# Altium schematic sheet HDMI2.0_SHEET.SchDoc
size A4; SheetNumber: 21; SheetTotal: 23
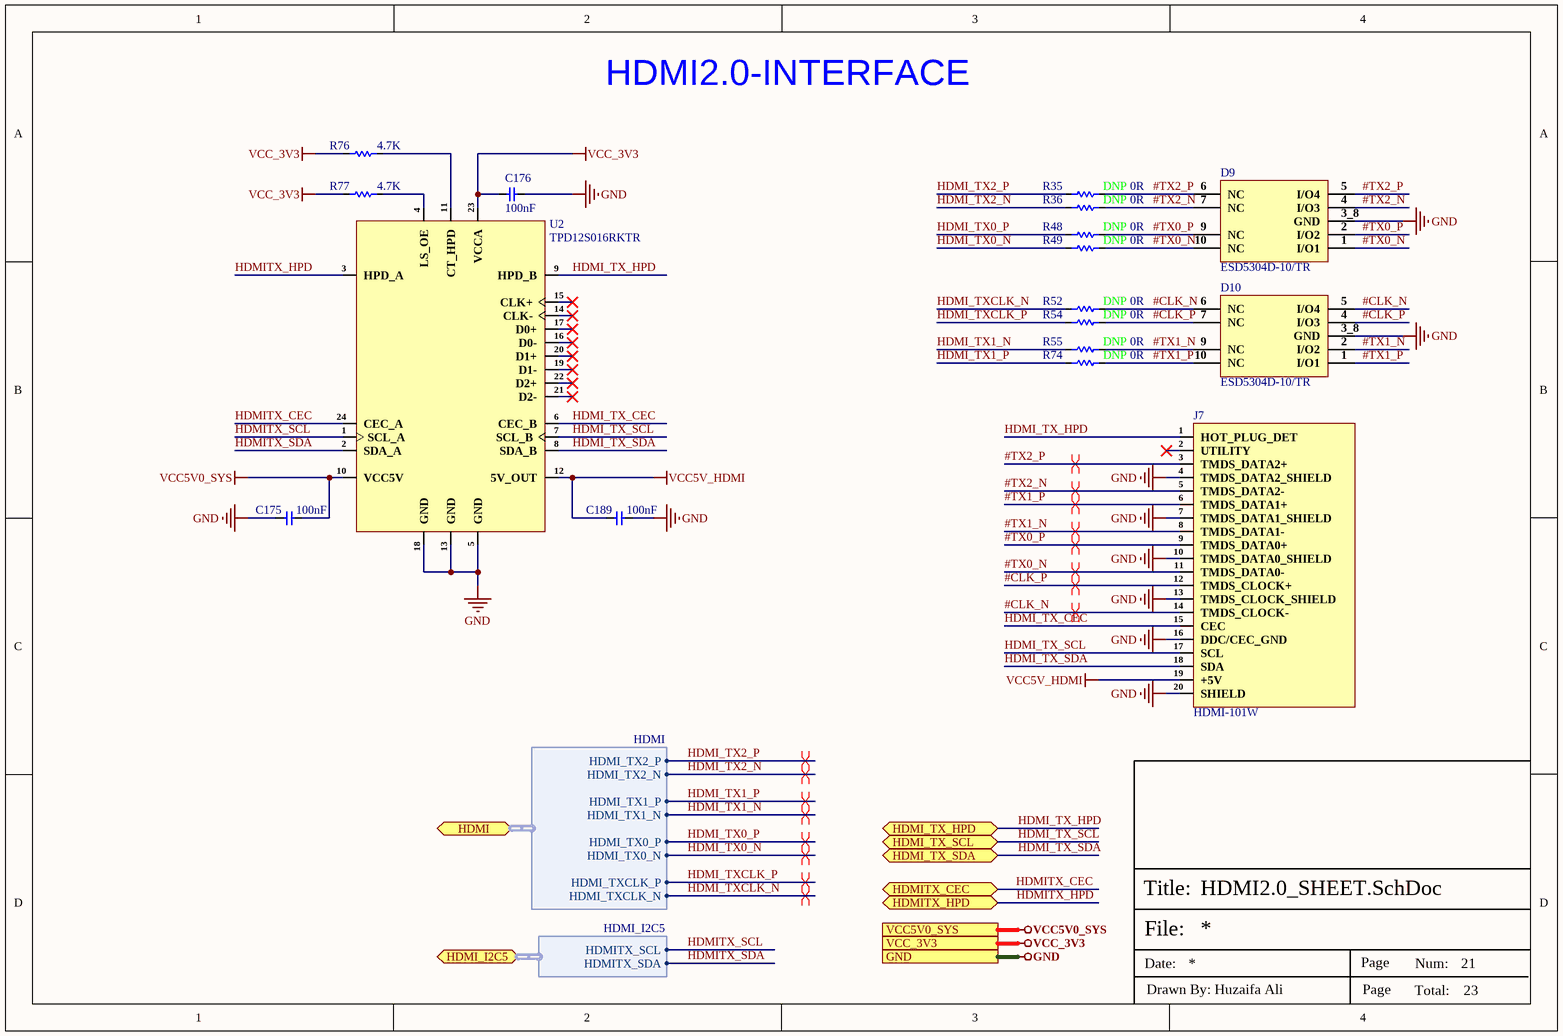
[diagram p0: HDMI2.0_SHEET.SchDoc]

## Parts
C175  100nF  [Cap-0402]
C176  100nF  [Cap-0402]
C189  100nF  [Cap-0402]
D9  ESD5304D-10/TR  [DFN2510-10L_]
D10  ESD5304D-10/TR  [DFN2510-10L_]
J7  HDMI-101W  [HDMI-101W]
R35  DNP  [Res-0201]
R36  DNP  [Res-0201]
R48  DNP  [Res-0201]
R49  DNP  [Res-0201]
R52  DNP  [Res-0201]
R54  DNP  [Res-0201]
R55  DNP  [Res-0201]
R74  DNP  [Res-0201]
R76  4.7K  [Res-0402]
R77  4.7K  [Res-0402]
U2  TPD12S016RKTR  [24-UQFN (4x2)]

## Ports
GND (see DRAM_LPDDR4_SHEET[6D], eMMC_SPI-FLASH_SHEET[1D], HDMI_TO_TYPE-C_SHEET[5D], POWER_LDO_SHEET[3D], POWER_OTHER_SHEET[3C], POWER_PMIC_RK809_CODEC[3C], POWER_PMIC_RK809_DC DC[3D], POWER_PMIC_RK809_LDO[4C], POWER_PMIC_RK809_MGM[3D], RK3566_AUDIO_SHEET[3C], RK3566_DDR-PHY_SHEET[5D], RK3566_FLASH-SD_SHEET[4C], RK3566_OSC_PMUIO_SHEET[5D], RK3566_POWER_SHEET[3D], RK3566_SARADC_GPIO[3D], RK3566_USB_PCIe_SHEET[3D], RK3566_VI_SHEET[3D], RK3566_VO_SHEET_1[3C], RK3566_VO_SHEET_2[4C], TYPE-C_INTERFACE_SHEET[3D], USB2.0_SHEET[3D], WIFI-6_SHEET[3D]), HDMI (bidir, harness HDMI, see HDMI_TO_TYPE-C_SHEET[2D], RK3566_VO_SHEET_1[2C]), HDMI_I2C5 (bidir, harness HDMI_I2C5, see RK3566_AUDIO_SHEET[3B]), HDMI_TX_HPD (bidir, see HDMI_TO_TYPE-C_SHEET[5D]), HDMI_TX_SCL (bidir, see HDMI_TO_TYPE-C_SHEET[5D]), HDMI_TX_SDA (bidir, see HDMI_TO_TYPE-C_SHEET[5D]), HDMITX_CEC (bidir, see RK3566_AUDIO_SHEET[3C]), HDMITX_HPD (bidir, see RK3566_VO_SHEET_1[3C]), VCC5V0_SYS (see HDMI_TO_TYPE-C_SHEET[5D], POWER_LDO_SHEET[3D], POWER_OTHER_SHEET[3C], POWER_PMIC_RK809_CODEC[3C], POWER_PMIC_RK809_MGM[3D], RK3566_USB_PCIe_SHEET[3C], TYPE-C_INTERFACE_SHEET[3D], USB2.0_SHEET[3D]), VCC_3V3 (see eMMC_SPI-FLASH_SHEET[1D], HDMI_TO_TYPE-C_SHEET[5D], POWER_PMIC_RK809_LDO[4C], RK3566_AUDIO_SHEET[3C], RK3566_SARADC_GPIO[3D], RK3566_USB_PCIe_SHEET[3D], RK3566_VO_SHEET_2[4C], WIFI-6_SHEET[3D])

## Harnesses
HDMI_I2C5: HDMITX_SCL, HDMITX_SDA
HDMI: HDMI_TX2_P, HDMI_TX2_N, HDMI_TX1_P, HDMI_TX1_N, HDMI_TX0_P, HDMI_TX0_N, HDMI_TXCLK_P, HDMI_TXCLK_N

## Nets
GND: C175.2 C176.1 C189.2 D9.3_8(GND) D10.3_8(GND) J7.4(TMDS_DATA2_SHIELD) J7.7(TMDS_DATA1_SHIELD) J7.10(TMDS_DATA0_SHIELD) J7.13(TMDS_CLOCK_SHIELD) J7.16(DDC/CEC_GND) J7.20(SHIELD) U2.5(GND) U2.13(GND) U2.18(GND) ; port GND
VCC5V0_SYS: C175.1 U2.10(VCC5V) ; port VCC5V0_SYS
VCC5V_HDMI: C189.1 J7.19(+5V) U2.12(5V_OUT)
VCC_3V3: C176.2 R76.2 R77.2 U2.23(VCCA) ; port VCC_3V3
#CLK_N: D10.5(I/O4) D10.6(NC) J7.14(TMDS_CLOCK-) R52.2
#CLK_P: D10.4(I/O3) D10.7(NC) J7.12(TMDS_CLOCK+) R54.2
#TX0_N: D9.1(I/O1) D9.10(NC) J7.11(TMDS_DATA0-) R49.2
#TX0_P: D9.2(I/O2) D9.9(NC) J7.9(TMDS_DATA0+) R48.2
#TX1_N: D10.2(I/O2) D10.9(NC) J7.8(TMDS_DATA1-) R55.2
#TX1_P: D10.1(I/O1) D10.10(NC) J7.6(TMDS_DATA1+) R74.2
#TX2_N: D9.4(I/O3) D9.7(NC) J7.5(TMDS_DATA2-) R36.2
#TX2_P: D9.5(I/O4) D9.6(NC) J7.3(TMDS_DATA2+) R35.2
HDMI_TX0_N: R49.1 ; port HDMI.HDMI_TX0_N
HDMI_TX0_P: R48.1 ; port HDMI.HDMI_TX0_P
HDMI_TX1_N: R55.1 ; port HDMI.HDMI_TX1_N
HDMI_TX1_P: R74.1 ; port HDMI.HDMI_TX1_P
HDMI_TX2_N: R36.1 ; port HDMI.HDMI_TX2_N
HDMI_TX2_P: R35.1 ; port HDMI.HDMI_TX2_P
HDMI_TX_CEC: J7.15(CEC) U2.6(CEC_B)
HDMI_TX_HPD: J7.1(HOT_PLUG_DET) U2.9(HPD_B) ; port HDMI_TX_HPD
HDMI_TX_SCL: J7.17(SCL) U2.7(SCL_B) ; port HDMI_TX_SCL
HDMI_TX_SDA: J7.18(SDA) U2.8(SDA_B) ; port HDMI_TX_SDA
HDMI_TXCLK_N: R52.1 ; port HDMI.HDMI_TXCLK_N
HDMI_TXCLK_P: R54.1 ; port HDMI.HDMI_TXCLK_P
HDMITX_CEC: U2.24(CEC_A) ; port HDMITX_CEC
HDMITX_HPD: U2.3(HPD_A) ; port HDMITX_HPD
HDMITX_SCL: U2.1(SCL_A) ; port HDMI_I2C5.HDMITX_SCL
HDMITX_SDA: U2.2(SDA_A) ; port HDMI_I2C5.HDMITX_SDA
NetR76_1: R76.1 U2.11(CT_HPD)
NetR77_1: R77.1 U2.4(LS_OE)

Not connected (* = marked no-connect by the designer): J7 2(UTILITY)*; U2 14(CLK-)* 15(CLK+)* 16(D0-)* 17(D0+)* 19(D1-)* 20(D1+)* 21(D2-)* 22(D2+)*

## Layout directives
differential pair; differential pair class HDMI_100R: #CLK_N, #CLK_P, #TX0_N, #TX0_P, #TX1_N, #TX1_P, #TX2_N, #TX2_P, HDMI_TX0_N, HDMI_TX0_P, HDMI_TX1_N, HDMI_TX1_P, HDMI_TX2_N, HDMI_TX2_P, HDMI_TXCLK_N, HDMI_TXCLK_P

## Notes on the sheet
- HDMI2.0-INTERFACE
- 0R
- File:
- Title:
- Date:
- Page
- Num:
- Total:
- Drawn By: Huzaifa Ali

## Library data of the parts
C175 C176 C189 = CC0402KRX5R7BB104: CAP CER 0.1UF 16V X5R 0402; Manufacturer: Yageo; Tolerance: 10%; Manufacturer Part Number: CC0402KRX5R7BB104; RoHS: Yes; Category: Ceramic Capacitors; Supplier 1: Mouser; Stock 1: 936792; Pricing 1: 1=0.10000, 10=0.02300, 50=0.02300, 100=0.01100, 1000=0.00600, 10000=0.00400 (USD); Mount: Surface Mount; Case/Package: 0402; Number of Pins: 2; Case Code (Metric): 1005; Case Code (Imperial): 0402; Min Operating Temperature: -55°C; Max Operating Temperature: 85°C; Capacitance: 100nF; Dielectric: X5R; Packaging: Tape and Reel; Voltage Rating: 16V; Package Quantity: 1; Voltage Rating (DC): 16V; Termination: SMD/SMT; Resistor Type: Ceramic; Series: CC; Construction: Flat; Length: 1mm; Width: 0.02inch; Height: 0.5mm; Thickness: 0.022inch; Depth: 0.5mm; Radiation Hardening: No; REACH SVHC: Unknown; Lead Free: Lead Free; Halogen Free: Halogen Free; RoHS Compliant: Yes; ComponentLink1URL: https://datasheet.ciiva.com/155/mlccorderingcode-155879.pdf?src-supplier=Digi-Key; ComponentLink1Description: https://datasheet.ciiva.com/155/mlccorderingcode-155879.pdf?src-supplier=Digi-Key; ComponentLink2URL: https://datasheet.ciiva.com/155/mlccorderingcode-155878.pdf?src-supplier=Digi-Key; ComponentLink2Description: https://datasheet.ciiva.com/155/mlccorderingcode-155878.pdf?src-supplier=Digi-Key; ComponentLink3URL: https://datasheet.ciiva.com/155/mlccorderingcode-155880.pdf?src-supplier=Digi-Key; ComponentLink3Description: https://datasheet.ciiva.com/155/mlccorderingcode-155880.pdf?src-supplier=Digi-Key; ComponentLink4URL: https://datasheet.ciiva.com/11464/upy-gphc-x5r-4v-to-50v-12-11464869.pdf?src-supplier=Avnet; ComponentLink4Description: https://datasheet.ciiva.com/11464/upy-gphc-x5r-4v-to-50v-12-11464869.pdf?src-supplier=Avnet; Supplier Part Number 1: 603-CC402KRX5R7BB104; LCSC Part Number: C106204
D9 D10 = ESD5304D-10/TR: 4A@8/20us 12V 7V 5V Unidirectional DFN2510-10L TVS ROHS; Manufacturer: WILLSEMI; Item Type: Diode; Package: DFN2510-10L; LCSC Part Number: C153722; Manufacturer Part Number: ESD5304D-10/TR; ComponentLink1Description: LCSC; ComponentLink1URL: https://www.lcsc.com/product-detail/TVS_WILLSEMI-Will-Semicon-ESD5304D-10-TR_C153722.html
J7 = HDMI-101W: SMD HDMI Connectors ROHS; Manufacturer: XUNPU; Manufacturer Part Number: HDMI-101W; Package: SMD; LCSC Part Number: C720619; Item Type: Connector; ComponentLink1Description: LCSC; ComponentLink1URL: https://www.lcsc.com/product-detail/HDMI-Connectors_XUNPU-HDMI-101W_C720619.html
R35 R36 R48 R49 R52 R54 R55 R74 = RC0201JR-070RL: RES SMD 0 OHM JUMPER 1/20W 0201; Manufacturer: Yageo; Resistance: 0R; Tolerance: 5%; Power Rating: 50mW; Voltage Rating: 25V; Supplier 1: Digi-Key; Manufacturer Part Number: RC0201JR-070RL; RoHS: Yes; Stock 1: 11079; Pricing 1: 1=0.10000, 10=0.03600, 25=0.02640, 50=0.02000, 100=0.01480, 250=0.01128, 500=0.00904, 1000=0.00665, 5000=0.00477 (USD); Case/Package: 0201; Contact Plating: Tin,Matte; Case Code (Imperial): 0201; Case Code (Metric): 0603; Size Code: 0201; Min Operating Temperature: -55°C; Max Operating Temperature: 125°C; Resistor Type: Thick Film; Packaging: Tape and Reel; Termination: SMD/SMT; Features: Moisture Resistant; Series: RC; Max Power Dissipation: 50mW; Number of Terminations: 2; Length: 0.6mm; Width: 0.012inch; Height: 0.01inch; Radiation Hardening: No; Lead Free: Lead Free; RoHS Compliant: Yes; ComponentLink1URL: https://datasheet.ciiva.com/7672/1563626-7672247.pdf?src-supplier=Element14; ComponentLink1Description: https://datasheet.ciiva.com/7672/1563626-7672247.pdf?src-supplier=Element14; ComponentLink2URL: https://datasheet.ciiva.com/7660/1421516-7660808.pdf?src-supplier=Element14; ComponentLink2Description: https://datasheet.ciiva.com/7660/1421516-7660808.pdf?src-supplier=Element14; Supplier Part Number 1: 311-0.0NCT-ND; LCSC Part Number: C106228; Category: Chip SMD Resistors; Weight: 6E-06oz; Package Quantity: 10000; Voltage Rating (DC): 25V; Construction: Rectangular; Resistance Tolerance: 5%; Depth: 0.3mm; REACH SVHC: Unknown; Military Standard: Not; ComponentLink3URL: https://datasheet.ciiva.com/7672/1563626-7672248.pdf?src-supplier=Element14; ComponentLink3Description: https://datasheet.ciiva.com/7672/1563626-7672248.pdf?src-supplier=Element14; ComponentLink4URL: https://datasheet.ciiva.com/16855/pyu-rc0201-51-rohs-l-8-16855994.pdf?src-supplier=Avnet+Europe; ComponentLink4Description: https://datasheet.ciiva.com/16855/pyu-rc0201-51-rohs-l-8-16855994.pdf?src-supplier=Avnet+Europe; ComponentLink5URL: https://datasheet.ciiva.com/28419/pyu-rc0201-51-rohs-l-8-28419660.pdf?src-supplier=Avnet+Europe; ComponentLink5Description: https://datasheet.ciiva.com/28419/pyu-rc0201-51-rohs-l-8-28419660.pdf?src-supplier=Avnet+Europe; ComponentLink6URL: https://datasheet.ciiva.com/46391/1421516-46391340.pdf?src-supplier=Element14; ComponentLink6Description: https://datasheet.ciiva.com/46391/1421516-46391340.pdf?src-supplier=Element14; ComponentLink7URL: https://datasheet.ciiva.com/8896/pyu-rc0201-51-rohs-l-8-8896143.pdf?src-supplier=Avnet; ComponentLink7Description: https://datasheet.ciiva.com/8896/pyu-rc0201-51-rohs-l-8-8896143.pdf?src-supplier=Avnet
R76 R77 = RC0402FR-074K7L: RES 4.7K OHM 1% 1/16W 0402; Manufacturer: Yageo; Max Power Dissipation: 63mW; Temperature Coefficient: 100ppm/°C; Resistance: 4.7kR; Voltage Rating (DC): 50V; Power Rating: 62.5mW; Item Type: Resistor; Manufacturer Part Number: RC0402FR-074K7L; RoHS: Yes; Category: Chip SMD Resistors; Case/Package: 0402; Case Code (Imperial): 0402; Case Code (Metric): 1005; Min Operating Temperature: -55°C; Max Operating Temperature: 155°C; Features: Moisture Resistant; Packaging: Tape and Reel; Tolerance: 1%; Number of Terminations: 2; Series: RC; RoHS Compliant: Yes; ComponentLink1URL: https://datasheet.ciiva.com/22661/1686128-22661342.pdf?src-supplier=Element14; ComponentLink1Description: https://datasheet.ciiva.com/22661/1686128-22661342.pdf?src-supplier=Element14; Supplier 1: Avnet; Stock 1: 2420000; Pricing 1: 10000=0.00085 (USD); Number of Pins: 2; Resistor Type: Thick Film; Voltage Rating: 50V; Termination: SMD/SMT; Resistance Tolerance: 1%; Construction: Rectangular; Length: 1mm; Width: 0.5mm; Height: 0.32mm; Depth: 0.5mm; Lead Free: Lead Free; Military Standard: Not; ComponentLink2URL: https://datasheet.ciiva.com/7850/1018594-7850022.pdf?src-supplier=Element14; ComponentLink2Description: https://datasheet.ciiva.com/7850/1018594-7850022.pdf?src-supplier=Element14; ComponentLink3URL: https://datasheet.ciiva.com/7850/1018594-7850023.pdf?src-supplier=Element14; ComponentLink3Description: https://datasheet.ciiva.com/7850/1018594-7850023.pdf?src-supplier=Element14; ComponentLink4URL: https://datasheet.ciiva.com/15215/getdatasheetpartid-328119-15215035.pdf?src-supplier=Verical; ComponentLink4Description: https://datasheet.ciiva.com/15215/getdatasheetpartid-328119-15215035.pdf?src-supplier=Verical; Supplier Part Number 1: RC0402FR-074K7L; LCSC Part Number: C105871; Size Code: 0402; Height - Seated (Max): 0.016inch; Reach SVHC Compliant: Yes
U2 = TPD12S016RKTR: IC INTERFACE SPECIALIZED 24UQFN; Manufacturer: Texas Instruments; Supplier: Mouser; Supplier Part Number: 595-TPD12S016RKTR; Manufacturer Part Number: TPD12S016RKTR; RoHS: Yes; Category: Interface ICs; Stock: 5223; Pricing: 1=0.82, 10=0.694, 50=0.694, 100=0.537, 1000=0.443, 10000=0.442 (USD); ComponentLink1URL: https://datasheet.ciiva.com/12545/tpd12s016-108314-12545332.pdf?src-supplier=Mouser; ComponentLink1Description: https://datasheet.ciiva.com/12545/tpd12s016-108314-12545332.pdf?src-supplier=Mouser; ComponentLink2URL: https://datasheet.ciiva.com/14195/tpd12s016-14195158.pdf?src-supplier=Avnet; ComponentLink2Description: https://datasheet.ciiva.com/14195/tpd12s016-14195158.pdf?src-supplier=Avnet; ComponentLink3URL: https://datasheet.ciiva.com/6632/tpd12s016-6632086.pdf?src-supplier=Digikey; ComponentLink3Description: https://datasheet.ciiva.com/6632/tpd12s016-6632086.pdf?src-supplier=Digikey